# Altium project VCU_HW.PrjPcb
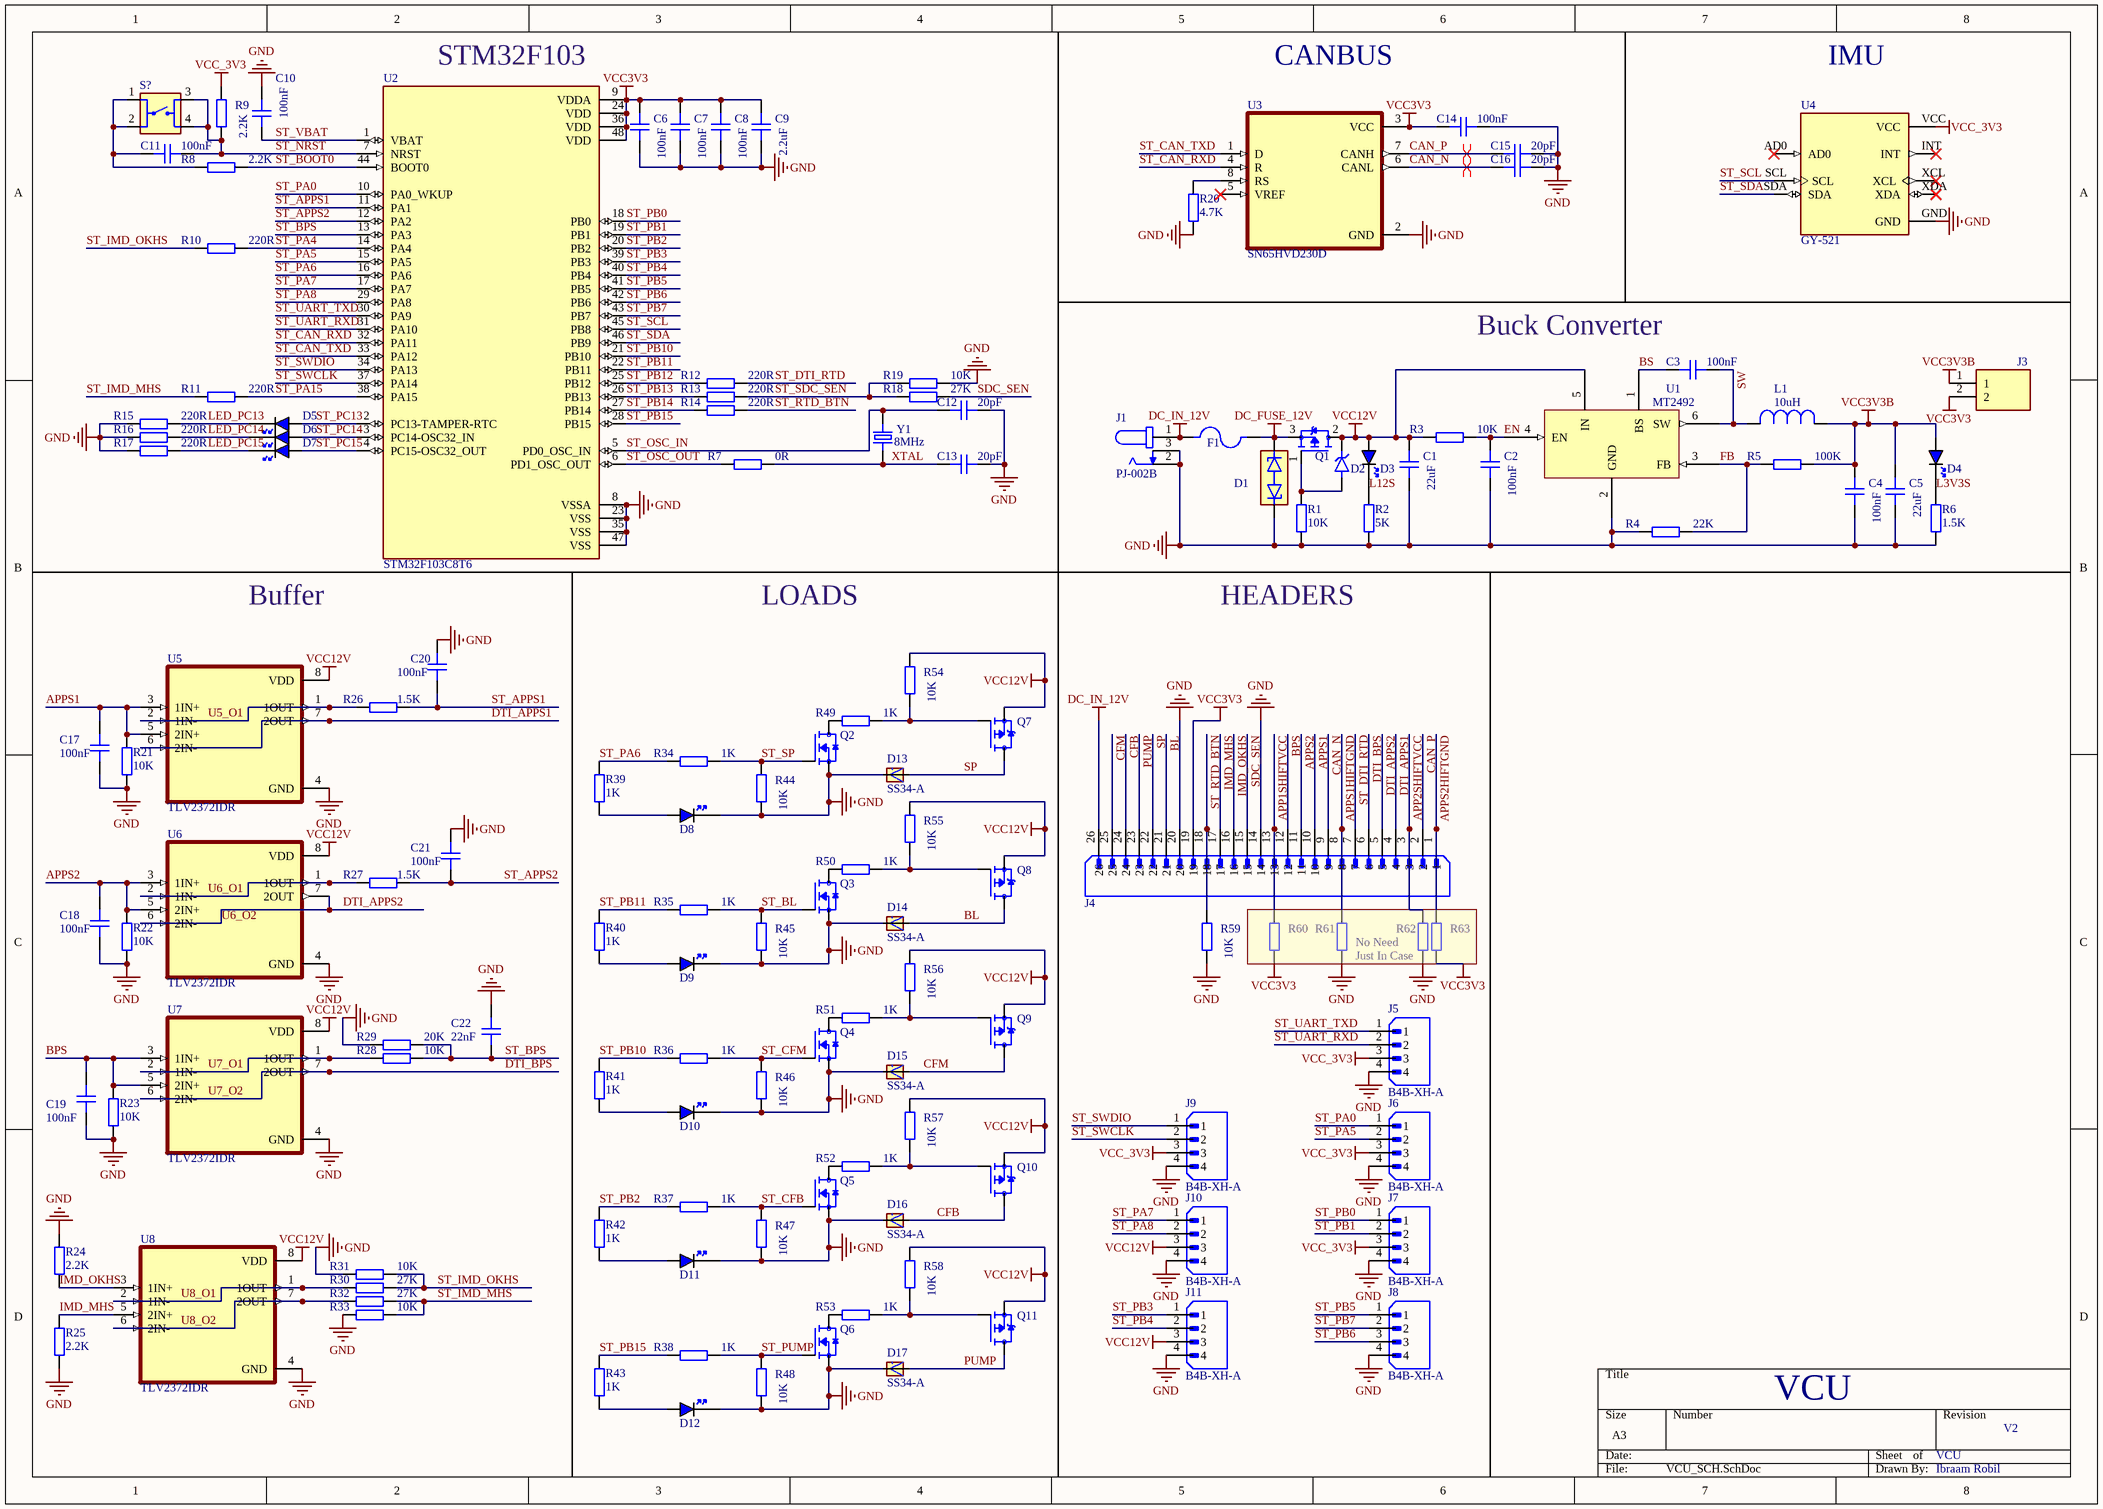
[diagram p0: VCU_SCH.SchDoc]
1 sheet, 135 parts. Net scope: global (net labels, ports and power ports of the same name join across sheets).
Board file: VCU_PCB.PcbDoc

## Sheet VCU_SCH.SchDoc
size A3; SheetNumber: 1; SheetTotal: 1

### Parts
C1  22uF  [CAP_0805]
C2  100nF  [CAP_0805]
C3  100nF  [CAP_0805]
C4  100nF  [CAP_0805]
C5  22uF  [CAP_0805]
C6  100nF  [CAP_0805]
C7  100nF  [CAP_0805]
C8  100nF  [CAP_0805]
C9  2.2uF  [CAP_0805]
C10  100nF  [CAP_0805]
C11  100nF  [CAP_0805]
C12  20pF  [CAP_0805]
C13  20pF  [CAP_0805]
C14  100nF  [CAP_0805]
C15  20pF  [CAP_0805]
C16  20pF  [CAP_0805]
C17  100nF  [CAP_0805]
C18  100nF  [CAP_0805]
C19  100nF  [CAP_0805]
C20  100nF  [CAP_0805]
C21  100nF  [CAP_0805]
C22  22nF  [CAP_0805]
D1  PESD1LIN  [DIO_PESD1LIN]  (value not drawn)
D2  ZMM2V2  [DIOMELF3514N]  (value not drawn)
D3  BLUE  [LED_0805_BLUE]  (value not drawn)
D4  BLUE  [LED_0805_BLUE]  (value not drawn)
D5  BLUE  [LED_0805_BLUE]  (value not drawn)
D6  BLUE  [LED_0805_BLUE]  (value not drawn)
D7  BLUE  [LED_0805_BLUE]  (value not drawn)
D8  BLUE  [LED_0805_BLUE]  (value not drawn)
D9  BLUE  [LED_0805_BLUE]  (value not drawn)
D10  BLUE  [LED_0805_BLUE]  (value not drawn)
D11  BLUE  [LED_0805_BLUE]  (value not drawn)
D12  BLUE  [LED_0805_BLUE]  (value not drawn)
D13  SS34-A  [DO-214AC]
D14  SS34-A  [DO-214AC]
D15  SS34-A  [DO-214AC]
D16  SS34-A  [DO-214AC]
D17  SS34-A  [DO-214AC]
F1  0697H0315-01  [FUSRR508W60L835T400H810]  (value not drawn)
J1  PJ-002B  [CUI_PJ-002B]
J3  3-644456-2  [TE_3-644456-2]  (value not drawn)
J4  9-6437287-8  [TE_9-6437287-8]  (value not drawn)
J5  B4B-XH-A  [JST_B4B-XH-A]
J6  B4B-XH-A  [JST_B4B-XH-A]
J7  B4B-XH-A  [JST_B4B-XH-A]
J8  B4B-XH-A  [JST_B4B-XH-A]
J9  B4B-XH-A  [JST_B4B-XH-A]
J10  B4B-XH-A  [JST_B4B-XH-A]
J11  B4B-XH-A  [JST_B4B-XH-A]
L1  10uH  [IND_CDRH127/LDNP-470MC_SUM]
Q1  IRF4905STRRPBF  [TRANS_IRF4905STRRPBF]  (value not drawn)
Q2  AO3400A  [SOT95P280X125-3N]  (value not drawn)
Q3  AO3400A  [SOT95P280X125-3N]  (value not drawn)
Q4  AO3400A  [SOT95P280X125-3N]  (value not drawn)
Q5  AO3400A  [SOT95P280X125-3N]  (value not drawn)
Q6  AO3400A  [SOT95P280X125-3N]  (value not drawn)
Q7  AO3407A  [SOT95P280X125-3N]  (value not drawn)
Q8  AO3407A  [SOT95P280X125-3N]  (value not drawn)
Q9  AO3407A  [SOT95P280X125-3N]  (value not drawn)
Q10  AO3407A  [SOT95P280X125-3N]  (value not drawn)
Q11  AO3407A  [SOT95P280X125-3N]  (value not drawn)
R1  10K  [RES_0805]
R2  5K  [RES_0805]
R3  10K  [RES_0805]
R4  22K  [RES_0805]
R5  100K  [RES_0805]
R6  1.5K  [RES_0805]
R7  0R  [RES_0805]
R8  2.2K  [RES_0805]
R9  2.2K  [RES_0805]
R10  220R  [RES_0805]
R11  220R  [RES_0805]
R12  220R  [RES_0805]
R13  220R  [RES_0805]
R14  220R  [RES_0805]
R15  220R  [RES_0805]
R16  220R  [RES_0805]
R17  220R  [RES_0805]
R18  27K  [RES_0805]
R19  10K  [RES_0805]
R20  4.7K  [RES_0805]
R21  10K  [RES_0805]
R22  10K  [RES_0805]
R23  10K  [RES_0805]
R24  2.2K  [RES_0805]
R25  2.2K  [RES_0805]
R26  1.5K  [RES_0805]
R27  1.5K  [RES_0805]
R28  10K  [RES_0805]
R29  20K  [RES_0805]
R30  27K  [RES_0805]
R31  10K  [RES_0805]
R32  27K  [RES_0805]
R33  10K  [RES_0805]
R34  1K  [RES_0805]
R35  1K  [RES_0805]
R36  1K  [RES_0805]
R37  1K  [RES_0805]
R38  1K  [RES_0805]
R39  1K  [RES_0805]
R40  1K  [RES_0805]
R41  1K  [RES_0805]
R42  1K  [RES_0805]
R43  1K  [RES_0805]
R44  10K  [RES_0805]
R45  10K  [RES_0805]
R46  10K  [RES_0805]
R47  10K  [RES_0805]
R48  10K  [RES_0805]
R49  1K  [RES_0805]
R50  1K  [RES_0805]
R51  1K  [RES_0805]
R52  1K  [RES_0805]
R53  1K  [RES_0805]
R54  10K  [RES_0805]
R55  10K  [RES_0805]
R56  10K  [RES_0805]
R57  10K  [RES_0805]
R58  10K  [RES_0805]
R59  10K  [RES_0805]
R60  (no value)  [RES_0805]
R61  (no value)  [RES_0805]
R62  (no value)  [RES_0805]
R63  (no value)  [RES_0805]
S?  FSM8JH  [SW_FSM8JH]  (value not drawn)
U1  MT2492  [PCBComponent_1 - duplicate]
U2  STM32F103C8T6  [QFP50P900X900X160-48N]
U3  SN65HVD230D  [SOIC127P599X175-8N]
U4  GY-521  [MODULE_GY-521]
U5  TLV2372IDR  [SOIC127P599X175-8N]
U6  TLV2372IDR  [SOIC127P599X175-8N]
U7  TLV2372IDR  [SOIC127P599X175-8N]
U8  TLV2372IDR  [SOIC127P599X175-8N]
Y1  8MHz  [XTAL_ECS-80-20-5PVX]

### Nets
DC_FUSE_12V: D1.2 F1.2 Q1.3(S)
DC_IN_12V: F1.1 J1.1 J4.26
GND: C1.2 C2.2 C4.2 C5.2 C6.2 C7.2 C8.2 C9.2 C10.1 C12.2 C13.2 C14.2 C15.2 C16.2 C17.1 C18.1 C19.1 C20.2 C21.2 C22.2 D1.1 D8.K D9.K D10.K D11.K D12.K D13.C D14.C D15.C D16.C D17.C J1.2 J1.3 J4.14 J4.20 J5.4 J6.4 J7.4 J8.4 J9.4 J10.4 J11.4 Q2.2(S) Q3.2(S) Q4.2(S) Q5.2(S) Q6.2(S) R1.1 R2.1 R4.1 R6.1 R15.1 R16.1 R17.1 R19.1 R20.1 R21.1 R22.1 R23.1 R24.1 R25.1 R29.1 R31.1 R33.1 R44.1 R45.1 R46.1 R47.1 R48.1 R59.1 R61.1 R62.1 U1.2(GND) U2.8(VSSA) U2.23(VSS) U2.35(VSS) U2.47(VSS) U3.2(GND) U4.GND U5.4(GND) U6.4(GND) U7.4(GND) U8.4(GND)
VCC3V3: C6.1 C7.1 C8.1 C9.1 C14.1 J3.2 J4.19 R60.1 R63.1 U2.9(VDDA) U2.24(VDD) U2.36(VDD) U2.48(VDD) U3.3(VCC)
VCC3V3B: C4.1 C5.1 D4.A J3.1 L1.1 R5.2
VCC12V: C1.1 D2.1(K) D3.A J10.3 J11.3 Q1.2(D) Q7.2(S) Q8.2(S) Q9.2(S) Q10.2(S) Q11.2(S) R3.1 R54.2 R55.2 R56.2 R57.2 R58.2 U1.5(IN) U5.8(VDD) U6.8(VDD) U7.8(VDD) U8.8(VDD)
VCC_3V3: J5.3 J6.3 J7.3 J9.3 R9.2 U4.VCC
APP1SHIFTVCC: J4.13 R60.2
APP2SHIFTVCC: J4.3 R62.2
APPS1: C17.2 J4.10 R21.2 U5.3(1IN+) U5.5(2IN+)
APPS1HIFTGND: J4.8 R61.2
APPS2: C18.2 J4.11 R22.2 U6.3(1IN+) U6.5(2IN+)
APPS2HIFTGND: J4.1 R63.2
BL: D14.A J4.21 Q8.3(D)
BPS: C19.2 J4.12 R23.2 U7.3(1IN+) U7.5(2IN+)
BS: C3.1 U1.1(BS)
CAN_N: C16.1 J4.9 U3.6(CANL)
CAN_P: C15.1 J4.2 U3.7(CANH)
CFB: D16.A J4.24 Q10.3(D)
CFM: D15.A J4.25 Q9.3(D)
DTI_APPS1: J4.4 U5.6(2IN-) U5.7(2OUT)
DTI_APPS2: J4.5 U6.6(2IN-) U6.7(2OUT)  [also labelled U6_O2]
DTI_BPS: J4.6 U7.6(2IN-) U7.7(2OUT)  [also labelled U7_O2]
EN: C2.1 R3.2 U1.4(EN)
FB: R4.2 R5.1 U1.3(FB)
IMD_MHS: J4.17 R25.2 U8.5(2IN+)
IMD_OKHS: J4.16 R24.2 U8.3(1IN+)
L3V3S: D4.K R6.2
L12S: D3.K R2.2
LED_PC13: D5.K R15.2
LED_PC14: D6.K R16.2
LED_PC15: D7.K R17.2
PUMP: D17.A J4.23 Q11.3(D)
SDC_SEN: J4.15 R18.1
SP: D13.A J4.22 Q7.3(D)
ST_APPS1: C20.1 R26.1 U2.11(PA1)
ST_APPS2: C21.1 R27.1 U2.12(PA2)
ST_BL: Q3.1(G) R35.2 R45.2
ST_BOOT0: R8.2 U2.44(BOOT0)
ST_BPS: C22.1 R28.2 R29.2 U2.13(PA3)
ST_CAN_RXD: U2.32(PA11) U3.4(R)
ST_CAN_TXD: U2.33(PA12) U3.1(D)
ST_CFB: Q5.1(G) R37.2 R47.2
ST_CFM: Q4.1(G) R36.2 R46.2
ST_DTI_RTD: J4.7 R12.2
ST_IMD_MHS: R11.1 R32.2 R33.2
ST_IMD_OKHS: R10.1 R30.2 R31.2
ST_NRST: C11.2 R9.1 S?.3 S?.4 U2.7(NRST)
ST_OSC_IN: C12.1 U2.5(PD0_OSC_IN) Y1.2
ST_OSC_OUT: R7.1 U2.6(PD1_OSC_OUT)
ST_PA0: J6.1 U2.10(PA0_WKUP)
ST_PA4: R10.2 U2.14(PA4)
ST_PA5: J6.2 U2.15(PA5)
ST_PA6: R34.1 R39.2 U2.16(PA6)
ST_PA7: J10.1 U2.17(PA7)
ST_PA8: J10.2 U2.29(PA8)
ST_PA15: R11.2 U2.38(PA15)
ST_PB0: J7.1 U2.18(PB0)
ST_PB1: J7.2 U2.19(PB1)
ST_PB2: R37.1 R42.2 U2.20(PB2)
ST_PB3: J11.1 U2.39(PB3)
ST_PB4: J11.2 U2.40(PB4)
ST_PB5: J8.1 U2.41(PB5)
ST_PB6: J8.3 U2.42(PB6)
ST_PB7: J8.2 U2.43(PB7)
ST_PB10: R36.1 R41.2 U2.21(PB10)
ST_PB11: R35.1 R40.2 U2.22(PB11)
ST_PB12: R12.1 U2.25(PB12)
ST_PB13: R13.1 U2.26(PB13)
ST_PB14: R14.1 U2.27(PB14)
ST_PB15: R38.1 R43.2 U2.28(PB15)
ST_PC13: D5.A U2.2(PC13-TAMPER-RTC)
ST_PC14: D6.A U2.3(PC14-OSC32_IN)
ST_PC15: D7.A U2.4(PC15-OSC32_OUT)
ST_PUMP: Q6.1(G) R38.2 R48.2
ST_RTD_BTN: J4.18 R14.2 R59.2
ST_SCL: U2.45(PB8) U4.SCL
ST_SDA: U2.46(PB9) U4.SDA
ST_SDC_SEN: R13.2 R18.2 R19.2
ST_SP: Q2.1(G) R34.2 R44.2
ST_SWCLK: J9.2 U2.37(PA14)
ST_SWDIO: J9.1 U2.34(PA13)
ST_UART_RXD: J5.2 U2.31(PA10)
ST_UART_TXD: J5.1 U2.30(PA9)
ST_VBAT: C10.2 U2.1(VBAT)
SW: C3.2 L1.2 U1.6(SW)
U5_O1: R26.2 U5.1(1OUT) U5.2(1IN-)
U6_O1: R27.2 U6.1(1OUT) U6.2(1IN-)
U7_O1: R28.1 U7.1(1OUT) U7.2(1IN-)
U8_O1: R30.1 U8.1(1OUT) U8.2(1IN-)
U8_O2: R32.1 U8.6(2IN-) U8.7(2OUT)
XTAL: C13.1 R7.2 Y1.1
NetC11_1: C11.1 R8.1 S?.1 S?.2
NetD2_2: D2.2(A) Q1.1(G) R1.2
NetD8_A: D8.A R39.1
NetD9_A: D9.A R40.1
NetD10_A: D10.A R41.1
NetD11_A: D11.A R42.1
NetD12_A: D12.A R43.1
NetQ2_3: Q2.3(D) R49.1
NetQ3_3: Q3.3(D) R50.1
NetQ4_3: Q4.3(D) R51.1
NetQ5_3: Q5.3(D) R52.1
NetQ6_3: Q6.3(D) R53.1
NetQ7_1: Q7.1(G) R49.2 R54.1
NetQ8_1: Q8.1(G) R50.2 R55.1
NetQ9_1: Q9.1(G) R51.2 R56.1
NetQ10_1: Q10.1(G) R52.2 R57.1
NetQ11_1: Q11.1(G) R53.2 R58.1
NetR20_2: R20.2 U3.8(RS)

Not connected (* = marked no-connect by the designer): U3 5(VREF)*; U4 AD0* INT* XCL* XDA*

### Layout directives
differential pair: CAN_N, CAN_P

### Notes on the sheet
- (near U2) STM32F103
- CANBUS
- IMU
- (near C3) Buck Converter
- Buffer
- LOADS
- HEADERS
- (near R61) No Need
- (near R62) Just In Case
- VCU
- V2
- Ibraam Robil

### Library data of the parts
C1-C22 = CAP_0805: Capacitor SMD 0805; Manufacturer: *; Manufacturer Part Number: *; Distributor Link: *; LCSC: *; Rating: *; Dielectric: *
D1 = PESD1LIN: 44V, 70V Clamp 3A (8/20Âµs) Ipp Tvs Diode Surface Mount SOD-323; MF: Nexperia USA; SnapEDA_Link: https://www.snapeda.com/parts/PESD1LIN/Nexperia/view-part/?ref=snap; Package: SOD-323 Vishay Semiconductor Diodes Division; Value: *; MP: PESD1LIN; Check_prices: https://www.snapeda.com/parts/PESD1LIN/Nexperia/view-part/?ref=eda
D2 = ZMM2V2: 2.2V 500mW Silicon Epitaxial Planar Zener Diodes SMD MiniMELF (LL34); MF: Kingtronics; SnapEDA_Link: https://www.snapeda.com/parts/ZMM2V2/Kingtronics/view-part/?ref=snap; Package: None; Value: *; MP: ZMM2V2; Check_prices: https://www.snapeda.com/parts/ZMM2V2/Kingtronics/view-part/?ref=eda
D3-D12 = LED_0805_BLUE: LED 0805 BLUE SMD; Manufacturer: *; Manufacturer Part Number: *; Distributor Link: *; LCSC: *
D13-D17 = SS34-A: Schottky barrier diode, 3A, 40V; MF: hy electronic corp; MP: SS34A; SnapEDA_Link: https://www.snapeda.com/parts/SS34A/HY+Electronic/view-part/?ref=snap; Package: None; Value: *; Check_prices: https://www.snapeda.com/parts/SS34A/HY+Electronic/view-part/?ref=eda
F1 = 0697H0315-01: 2-Pin Radial Fuse | Rectangular | Slow Blow | UL | 315mA; MF: Bel Fuse; SnapEDA_Link: https://www.snapeda.com/parts/0697H0315-01/Bel+Circuit+Protection/view-part/?ref=snap; Package: Radial Box  Bel Fuse; Value: *; MP: 0697H0315-01; Check_prices: https://www.snapeda.com/parts/0697H0315-01/Bel+Circuit+Protection/view-part/?ref=eda
J1 = PJ-002B: 2.5 x 6.5 mm, 2.5 A, Horizontal, Through Hole, Dc Power Jack Connector; MF: Same Sky; SnapEDA_Link: https://www.snapeda.com/parts/PJ-002B/Same+Sky/view-part/?ref=snap; Package: None; Value: *; MP: PJ-002B; Check_prices: https://www.snapeda.com/parts/PJ-002B/Same+Sky/view-part/?ref=eda
J3 = 3-644456-2: HEADER ASSEMBLY, NARROW, MTA-100, 2 POSITION, STRAIGHT | TE Connectivity 3-644456-2; SnapEDA_Link: https://www.snapeda.com/parts/3-644456-2/TE+Connectivity+AMP+Connectors/view-part/?ref=snap; Package: None; Value: *; MF: TE Connectivity; MP: 3-644456-2; Check_prices: https://www.snapeda.com/parts/3-644456-2/TE+Connectivity+AMP+Connectors/view-part/?ref=eda
J4 = 9-6437287-8: MF: {'manufacturer': 'TE Connectivity'}; Package: None; Value: *; Availability: Unavailable; MP: 9-6437287-8; Price: None
J5-J11 = B4B-XH-A: Connector Header Through Hole 4 position 0.098 (2.50mm); MF: JST Sales; SnapEDA_Link: https://www.snapeda.com/parts/B4B-XH-A/JST/view-part/?ref=snap; Package: None; Value: *; MP: B4B-XH-A; Check_prices: https://www.snapeda.com/parts/B4B-XH-A/JST/view-part/?ref=eda
L1 = CDRH127/LDNP-470MC: Inductor Power Shielded Drum Core 47uH 20% 1KHz Ferrite 4.1A 0.078Ohm DCR T/R; MF: Sumida Corporation; SnapEDA_Link: https://www.snapeda.com/parts/CDRH127/LDNP-470MC/Sumida/view-part/?ref=snap; Package: Non Standard Sumida; Value: *; MP: CDRH127/LDNP-470MC; Check_prices: https://www.snapeda.com/parts/CDRH127/LDNP-470MC/Sumida/view-part/?ref=eda
Q1 = IRF4905STRRPBF: RoHS Compliant | Low RDS(on) | Industry-leading quality | Dynamic dv/dt Rating | Fast Switching | Fully Avalanche Rated | 175C Operating Temperature | P-Channel MOSFET; MF: Infineon Technologies; Package: D2PAK Infineon; Price: None; Availability: In Stock; Purchase-URL: https://pricing.snapeda.com/search/part/IRF4905STRRPBF/?ref=eda; Check_prices: https://www.snapeda.com/parts/IRF4905STRRPBF/Infineon+Technologies/view-part/?ref=eda; MP: IRF4905STRRPBF; SnapEDA_Link: https://www.snapeda.com/parts/IRF4905STRRPBF/Infineon+Technologies/view-part/?ref=snap; Value: *
Q2-Q6 = AO3400A: N-Channel 30 V 5.8A (Ta) 1.4W (Ta) Surface Mount SOT-23; MF: UMW; SnapEDA_Link: https://www.snapeda.com/parts/AO3400A/UMW/view-part/?ref=snap; Package: None; Value: *; MP: AO3400A; Check_prices: https://www.snapeda.com/parts/AO3400A/UMW/view-part/?ref=eda
Q7-Q11 = AO3407A: P-Channel 30 V 4.3A (Ta) 1.4W (Ta) Surface Mount SOT-23-3; MF: Alpha &; SnapEDA_Link: https://www.snapeda.com/parts/AO3407A/Alpha/view-part/?ref=snap; Package: SOT-23 Alpha &amp; Omega Semiconductor; Value: *; MP: AO3407A; Check_prices: https://www.snapeda.com/parts/AO3407A/Alpha/view-part/?ref=eda
R1-R63 = RES_0805: Resistor SMD 0805; Manufacturer: *; Manufacturer Part Number: *; Distributor Link: *; LCSC: *
S? = FSM8JH: Tactile Switch SPST-NO Top Actuated Through Hole; MF: TE Connectivity; Check_prices: https://www.snapeda.com/parts/FSM8JH/TE+Connectivity+ALCOSWITCH+Switches/view-part/?ref=eda; Value: *; Availability: In Stock; MP: FSM8JH; Price: None; Package: None; SnapEDA_Link: https://www.snapeda.com/parts/FSM8JH/TE+Connectivity+ALCOSWITCH+Switches/view-part/?ref=snap
U1 = MT2492: DC-DC step-down converter (buck converter)
U2 = STM32F103C8T6: ARM® Cortex®-M3 STM32F1 Microcontroller IC 32-Bit 72MHz 64KB (64K x 8) FLASH 48-LQFP (7x7); MF: STMicroelectronics; SnapEDA_Link: https://www.snapeda.com/parts/STM32F103C8T6/STMicroelectronics/view-part/?ref=snap; Package: LQFP-48 STMicroelectronics; Value: *; MP: STM32F103C8T6; Check_prices: https://www.snapeda.com/parts/STM32F103C8T6/STMicroelectronics/view-part/?ref=eda
U3 = SN65HVD230D: 3.3 V CAN Transceiver with Standby Mode; MF: Texas Instruments; SnapEDA_Link: https://www.snapeda.com/parts/SN65HVD230D/Texas+Instruments/view-part/?ref=snap; Package: SOIC-8 Texas Instruments; Value: *; MP: SN65HVD230D; Check_prices: https://www.snapeda.com/parts/SN65HVD230D/Texas+Instruments/view-part/?ref=eda
U4 = GY-521: Triple Axis Accelerometer Gyro Breakout; MF: GODREAM FORDREAM CO., LIMITED; SnapEDA_Link: https://www.snapeda.com/parts/GY-521/GODREAM+FORDREAM+CO.%252C+LIMITED/view-part/?ref=snap; Package: Package; Value: *; MP: GY-521; Check_prices: https://www.snapeda.com/parts/GY-521/GODREAM+FORDREAM+CO.%252C+LIMITED/view-part/?ref=eda
U5-U8 = TLV2372IDR: Dual, 16-V, 3-MHz, RRIO operational amplifier; MF: Texas Instruments; SnapEDA_Link: https://www.snapeda.com/parts/TLV2372IDR/Texas+Instruments/view-part/?ref=snap; Package: SOIC-8 Texas Instruments; Value: *; MP: TLV2372IDR; Check_prices: https://www.snapeda.com/parts/TLV2372IDR/Texas+Instruments/view-part/?ref=eda
Y1 = ECS-80-20-5PVX: SMD Quartz crystal; Package: None; Price: None; Value: *; MP: ECS-80-20-5PVX; Availability: Unavailable